# Altium schematic sheet EthIO_06_ADC.SchDoc
size A4; SheetNumber: 10; SheetTotal: 10
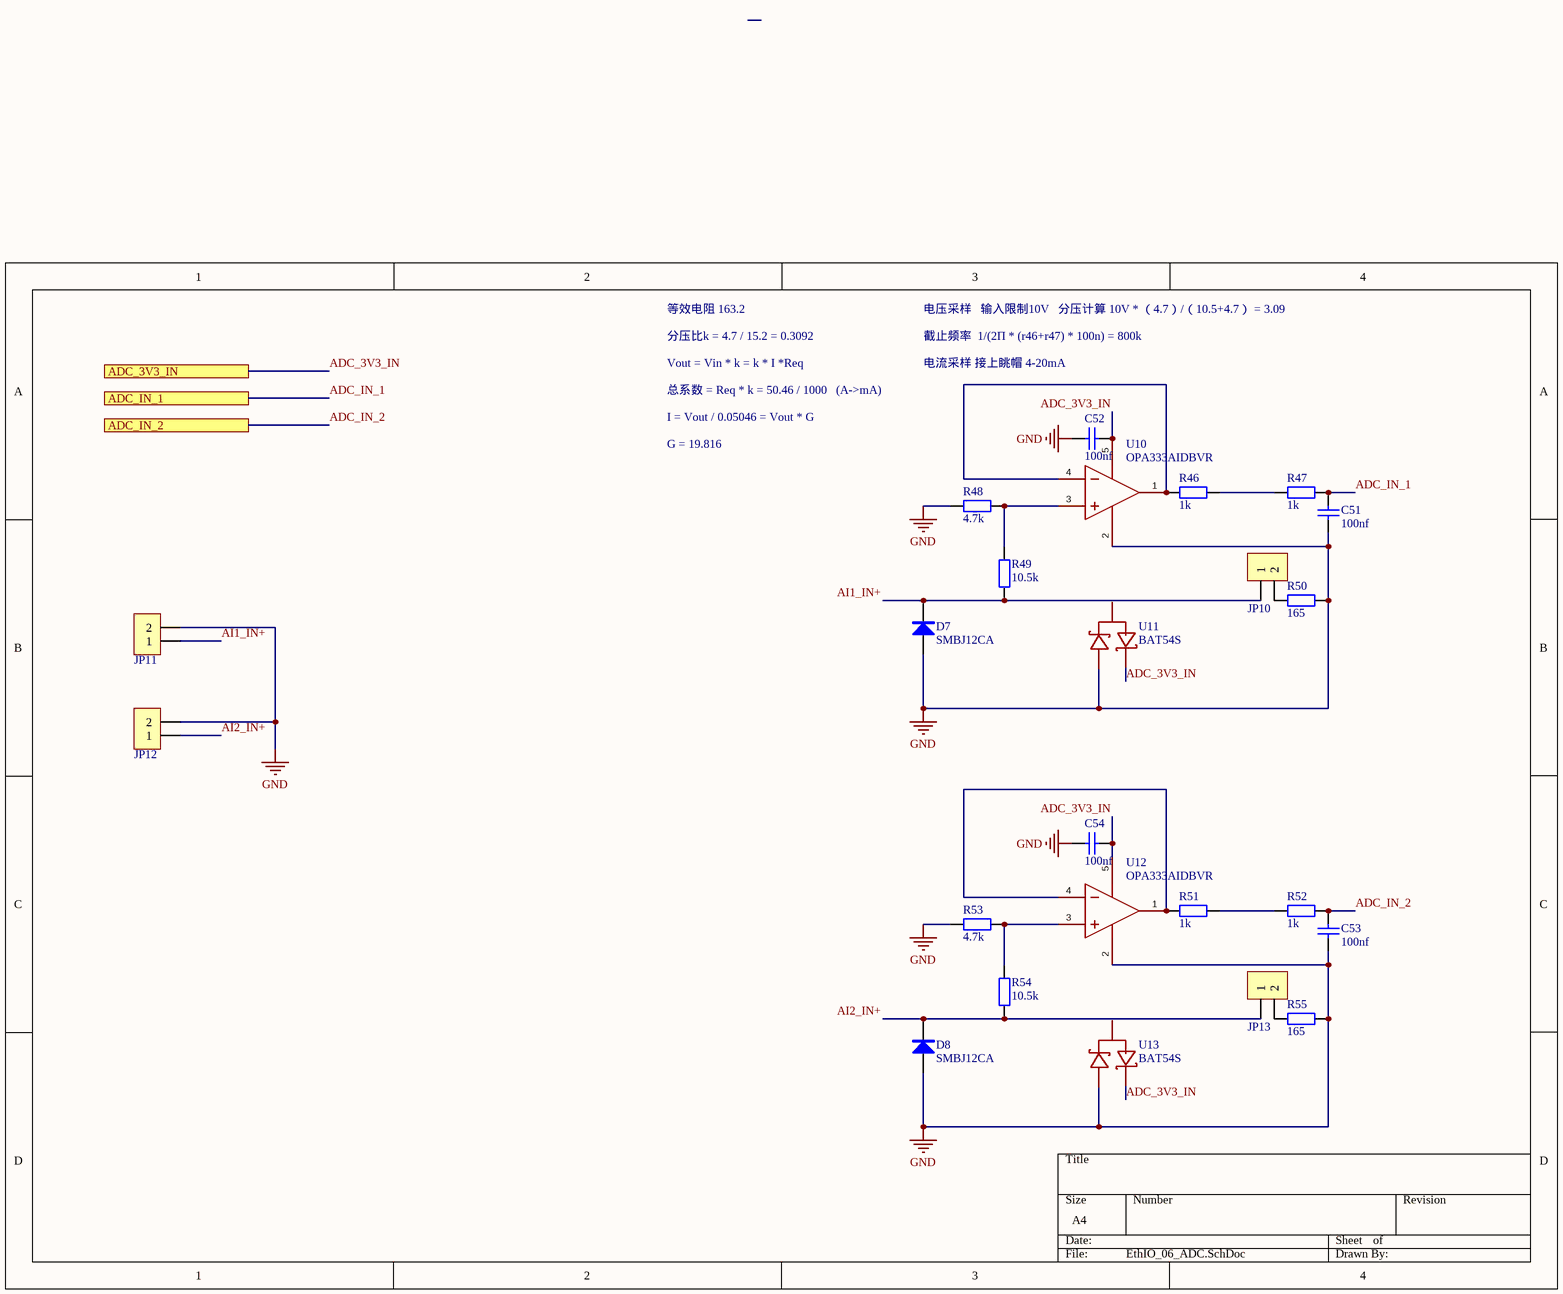
[diagram p0: EthIO_06_ADC.SchDoc]

## Parts
C51  100nf  [C0805_L]
C52  100nf  [C0805_L]
C53  100nf  [C0805_L]
C54  100nf  [C0805_L]
D7  SMBJ12CA  [SMB]
D8  SMBJ12CA  [SMB]
JP10  HDR-1X2  [HDR1.27-LI-2P]  (value not drawn)
JP11  HDR-1X2  [KF350-2P]  (value not drawn)
JP12  HDR-1X2  [KF350-2P]  (value not drawn)
JP13  HDR-1X2  [HDR1.27-LI-2P]  (value not drawn)
R46  1k  [R0805_L]
R47  1k  [R0805_L]
R48  4.7k  [R0805_L]
R49  10.5k  [R0805_L]
R50  165  [R0805_L]
R51  1k  [R0805_L]
R52  1k  [R0805_L]
R53  4.7k  [R0805_L]
R54  10.5k  [R0805_L]
R55  165  [R0805_L]
U10  OPA333AIDBVR  [OPA333AIDBVR]
U11  BAT54S  [BAT54S]
U12  OPA333AIDBVR  [OPA333AIDBVR]
U13  BAT54S  [BAT54S]

## Ports
ADC_3V3_IN, ADC_IN_1, ADC_IN_2

## Nets
GND: C51.2 C52.1 C53.2 C54.1 D7.1(A) D8.1(A) JP11.2 JP12.2 R48.2 R50.2 R53.2 R55.2 U10.2(V-) U11.1(K1) U12.2(V-) U13.1(K1)
ADC_3V3_IN: C52.2 C54.2 U10.5(V+) U11.2(K2) U12.5(V+) U13.2(K2) ; port ADC_3V3_IN
ADC_IN_1: C51.1 R47.2 ; port ADC_IN_1
ADC_IN_2: C53.1 R52.2 ; port ADC_IN_2
AI1_IN+: D7.2(K) JP10.1 JP11.1 R49.1
AI2_IN+: D8.2(K) JP12.1 JP13.1 R54.1
NetJP10_2: JP10.2 R50.1
NetJP13_2: JP13.2 R55.1
NetR46_1: R46.1 U10.1(OUT) U10.4(IN-)
NetR46_2: R46.2 R47.1
NetR48_1: R48.1 R49.2 U10.3(IN+)
NetR51_1: R51.1 U12.1(OUT) U12.4(IN-)
NetR51_2: R51.2 R52.1
NetR53_1: R53.1 R54.2 U12.3(IN+)

Not connected (* = marked no-connect by the designer): U11 3(A); U13 3(A)

## Notes on the sheet
- 等效电阻 163.2
- 分压比k = 4.7 / 15.2 = 0.3092
- Vout = Vin * k = k * I *Req
- 电压采样   输入限制10V   分压计算 10V * （4.7）/（10.5+4.7） = 3.09
- 截止频率  1/(2Π * (r46+r47) * 100n) = 800k
- 电流采样 接上眺帽 4-20mA
- I = Vout / 0.05046 = Vout * G
- 总系数 = Req * k = 50.46 / 1000   (A->mA)
- G = 19.816

## Library data of the parts
C51-C54 = C: 贴片电容/MLCC电容; BOM名称: 无极性贴片电容; 当前库版本V2022.12.25 @淘宝卖家:黄晶宝石: 最新版本发布https://shop463601444.taobao.com
D7 D8 = SMBJ12A-E3/52: 12V 600W瞬态抑制二极管; BOM名称: TVS瞬态抑制二极管; 当前库版本V2022.12.25 @淘宝卖家:黄晶宝石: 最新版本发布https://shop463601444.taobao.com; 属性: 12V 600W
JP10 JP13 = Header 2: 2P连接器; 联系卖家 免费查找封装: 唯一出售店铺网址https://shop463601444.taobao.com; BOM名称: 2P连接器
JP11 JP12 = Header 2: 2P接插件; 封装库来自淘宝卖家： 黄晶宝石: 其他店铺购入均为盗版封装库，无更新权益，退款现金奖励200~1000元; BOM名称: 2P接插件
R46-R55 = R: 贴片电阻; 联系下单店铺卖家 免费帮你查找封装: 联系下单店铺卖家 免费技术支持; BOM名称: 贴片电阻